# Altium schematic sheet 02_DISPLACEMENT.SchDoc
size A4; SheetNumber: 2; SheetTotal: 6
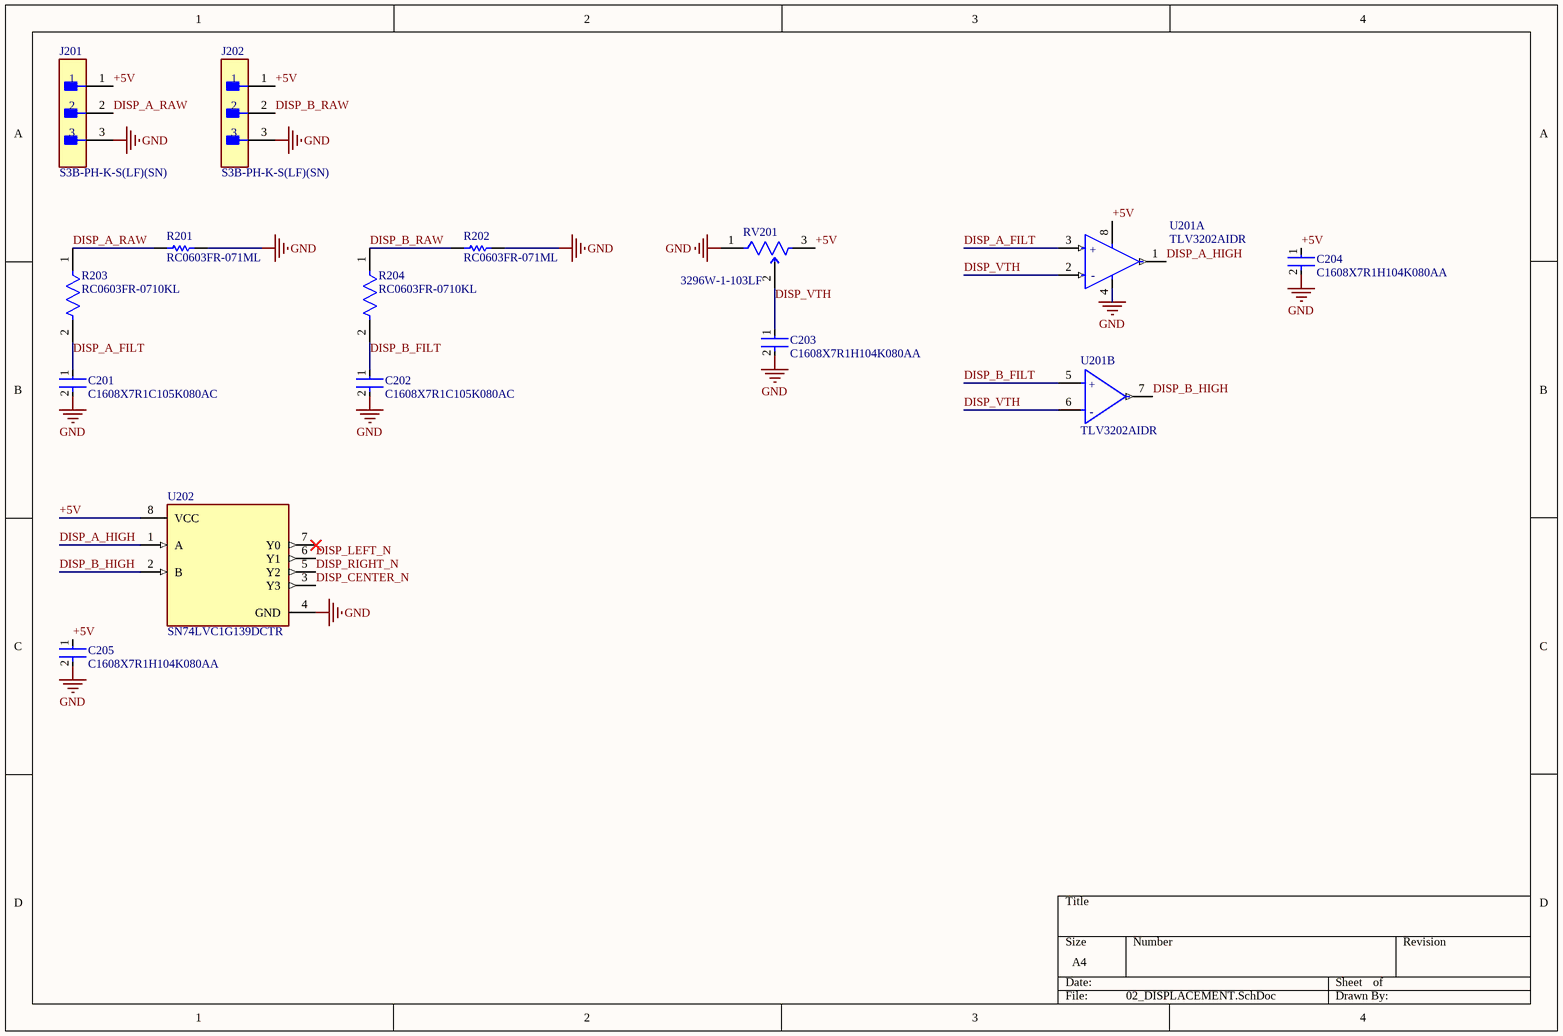
[diagram p0: 02_DISPLACEMENT.SchDoc]

## Parts
C201  C1608X7R1C105K080AC  [FP-C1608-080-0_1-IPC_B]
C202  C1608X7R1C105K080AC  [FP-C1608-080-0_1-IPC_B]
C203  C1608X7R1H104K080AA  [FP-C1608-080-0_1-IPC_B]
C204  C1608X7R1H104K080AA  [FP-C1608-080-0_1-IPC_B]
C205  C1608X7R1H104K080AA  [FP-C1608-080-0_1-IPC_B]
J201  S3B-PH-K-S(LF)(SN)  [FP-S3B-PH-K-S_LF_SN-MFG]
J202  S3B-PH-K-S(LF)(SN)  [FP-S3B-PH-K-S_LF_SN-MFG]
R201  RC0603FR-071ML  [RESC1608X55X25LL10T15]
R202  RC0603FR-071ML  [RESC1608X55X25LL10T15]
R203  RC0603FR-0710KL  [FP-RC0603-0_55-IPC_C]
R204  RC0603FR-0710KL  [FP-RC0603-0_55-IPC_C]
RV201  3296W-1-103LF  [FP-3296W-MFG]
U201  TLV3202AIDR  [FP-D0008A-IPC_B]  (parts A,B of 2)
U202  SN74LVC1G139DCTR  [FP-DCT0008A-MFG]

## Nets
GND: C201.2 C202.2 C203.2 C204.2 C205.2 J201.3 J202.3 R201.2 R202.2 RV201.1(CCW) U201.4(GND) U202.4(GND)
+5V: C204.1 C205.1 J201.1 J202.1 RV201.3(CW) U201.8(VCC) U202.8(VCC)
DISP_A_FILT: C201.1 R203.2 U201.3(1IN+)
DISP_A_HIGH: U201.1(1OUT) U202.1(A)
DISP_A_RAW: J201.2 R201.1 R203.1
DISP_B_FILT: C202.1 R204.2 U201.5(2IN+)
DISP_B_HIGH: U201.7(2OUT) U202.2(B)
DISP_B_RAW: J202.2 R202.1 R204.1
DISP_CENTER_N: U202.3(Y3)
DISP_LEFT_N: U202.6(Y1)
DISP_RIGHT_N: U202.5(Y2)
DISP_VTH: C203.1 RV201.2(WIPER) U201.2(1IN-) U201.6(2IN-)

Not connected (* = marked no-connect by the designer): U202 7(Y0)*

## Notes on the sheet
- (in symbol CMP-04896-000095-1, part A) +; -
- (in symbol CMP-04896-000095-1, part B) +; -

## Library data of the parts
C201 C202 = CMP-08246-002727-1: Multilayer Ceramic Capacitors 1μF ±10% 16V X7R SMD 0603; Capacitance: 1uF; Mount: Surface Mount; Width: 0.031inch; Radiation Hardening: No; Dielectric Material: Ceramic; Packaging: Tape and Reel; Voltage Rating: 16V; Weight: 7.1E-05oz; Termination: SMD/SMT; Package Quantity: 1; Voltage Rating (DC): 16V; REACH SVHC: No SVHC; Voltage: 16V; Min Operating Temperature: -55°C; Depth: 0.8mm; Height: 0.8mm; Length: 1.6mm; Case Code (Metric): 1608; Thickness: 0.037inch; Lead Free: Lead Free; Resistor Type: Ceramic; RoHS Compliant: Yes; Series: C; Construction: Flat; Max Operating Temperature: 125°C; Tolerance: 10%; Case/Package: 0603; Dielectric: X7R; Case Code (Imperial): 0603
C203-C205 = CMP-2000-04982-2: Multilayer Ceramic Capacitors 100nF ±10% 50V X7R SMD 0603; REACH SVHC: No SVHC; Voltage: 50V; Min Operating Temperature: -55°C; Package Quantity: 1; Case Code (Metric): 1608; Series: C; Termination: SMD/SMT; Length: 1.6mm; Voltage Rating: 50V; Case Code (Imperial): 0603; Number of Pins: 2; RoHS Compliant: Yes; Thickness: 0.037inch; Resistor Type: Ceramic; Radiation Hardening: No; Weight: 7.1E-05oz; Mount: Surface Mount; Capacitance: 100nF; Voltage Rating (DC): 50V; Construction: Flat; Tolerance: 10%; Lead Free: Lead Free; Case/Package: 0603; Max Operating Temperature: 125°C; Height: 0.8mm; Depth: 0.8mm; Packaging: Tape and Reel; Width: 0.031inch; Dielectric Material: Ceramic; Dielectric: X7R
J201 J202 = CMP-17439-000039-1: CONN HEADER R/A 3POS 2MM; Height: 0.31inch; Weight: 0.0625lb; Length: 0.31inch; Width: 0.31inch
R201 R202 = CMP-1659-00056-1: Chip Resistor, 1 MOhm, +/- 1%, 100 mW, -55 to 155 degC, 0603 (1608 Metric), RoHS, Tape and Reel; Voltage Rating (DC): 25 V; Tolerance: 20%; Case\Package: Radial; Capacitance: 1 mF; Min Operating Temperature: -40 degC; PackageDescription: 2-Pin Surface Mount Device, Body 1.6 x 0.8 mm; ComponentLink1Description: Manufacturer URL; Radiation Hardening: No; DatasheetVersion: Rev. 4, 02/2016; REACH SVHC: No SVHC; Length: 20 mm; Max Operating Temperature: 85 degC; Diameter: 10 mm; Packaging: Bulk; Package Quantity: 200; PackageReference: 0603; Mount: Through Hole; ComponentLink1URL: http://www.yageo.com/; ComponentLink2URL: http://www.yageo.com/documents/recent/PYu-RC_Group_51_RoHS_L_04.pdf; ComponentLink2Description: Datasheet; Width: 0 inch; Lead Pitch: 5 mm; RoHSCompliant: true; Voltage Rating: 25 V; Height: 20 mm
R203 R204 = CMP-2100-03664-2: RES 10K OHM 1% 1/10W 0603; Voltage Rating: 75V; Voltage Rating (DC): 50V; Resistance: 10kR; Power Rating: 100mW; Temperature Coefficient: 100ppm/°C; Depth: 0.8mm; Termination: SMD/SMT; Resistor Type: Thick Film; Series: RC; Construction: Rectangular; Features: Moisture Resistant; Packaging: Tape and Reel; Min Operating Temperature: -55°C; Number of Terminations: 2; Lead Pitch: 0.3mm; RoHS Compliant: Yes; Case/Package: 0603; Resistance Tolerance: 1%; Military Standard: Not; Weight: 7.1E-05oz; Number of Pins: 2; Tolerance: 1%; Length: 1.6mm; Case Code (Imperial): 0603; Lead Free: Lead Free; Width: 0.8mm; Max Power Dissipation: 100mW; Height: 0.45mm; Max Operating Temperature: 155°C; Case Code (Metric): 1608; Size Code: 0603
RV201 = CMP-1747-00001-8: TRIMMER 10K OHM 0.5W PC PIN TOP; Number of Turns: 25; Tolerance: 10%; Resistance: 10kR; Max Power Dissipation: 500mW; Temperature Coefficient: 100ppm/°C; Insulation Resistance: 1GR; Min Operating Temperature: -55°C; Resistor Type: Cermet; Series: 3296; Color: Blue; Mount: Through Hole; Taper: Linear; Radiation Hardening: No; RoHS Compliant: Yes; Width: 9.53mm; Resistance Tolerance: 10%; Contact Plating: Tin; Military Standard: Not; Package Quantity: 50; Weight: 0.03oz; Lead Free: Lead Free; Power Rating: 500mW; Termination: Pin; Technology: CERMET; Max Operating Temperature: 125°C; Packaging: Rail/Tube; Length: 9.53mm; Depth: 4.83mm; Height: 11.55mm; Reach SVHC Compliant: Yes
U201 = CMP-04896-000095-1: IC COMPARATOR RRI DUAL 8SOIC; Power Supply Rejection Ratio (PSRR): 85dB; Output Type: PUSH-PULL; Number of Channels: 2; Propagation Delay: 50ns; Input Bias Current: 50pA; Hysteresis: 1.2mV; Common Mode Rejection Ratio: 70dB; Max Supply Current: 40uA; Response Time: 0.047us; Max Supply Voltage: 5.5V; Quiescent Current: 50uA; Min Supply Voltage: 2.7V; Input Offset Voltage (Vos): 5mV; Number of Pins: 8; Series: TLV3202; Type: General Purpose; Max Operating Temperature: 125°C; Packaging: Tape and Reel; Mount: Surface Mount; Max Input Current: 50pA; RoHS Compliant: Yes; Package Quantity: 2500; Case/Package: SOIC; Radiation Hardening: No; Contact Plating: Gold; Min Operating Temperature: -40°C; Number of Elements: 2; Lead Free: Lead Free; Supply Current: 50uA; Nominal Supply Current: 50uA
U202 = CMP-0859-00561-4: IC DECODER/DEMUX 1 X 2:4 SM8; Supply Type: Single; Low Level Output Current: 32mA; Number of Bits: 1; Throw Configuration: DP4T; Max Supply Voltage: 5.5V; Logic Function: Demultiplexer; Polarity: Inverting; Number of Outputs: 4; Propagation Delay: 16.7ns; Number of Inputs: 2; Quiescent Current: 10uA; Min Supply Voltage: 1.65V; High Level Output Current: -32mA; Case/Package: SSOP; Independent Circuits: 1; Lead Free: Lead Free; Number of Elements: 1; Packaging: Tape and Reel; Mount: Surface Mount; REACH SVHC: No SVHC; Contact Plating: Gold; Number of Circuits: 1; Radiation Hardening: No; Number of Pins: 8; Number of Input Lines: 2; Weight: 0.000825oz; Min Operating Temperature: -40°C; Max Operating Temperature: 85°C; Package Quantity: 3000; Number of Output Lines: 4